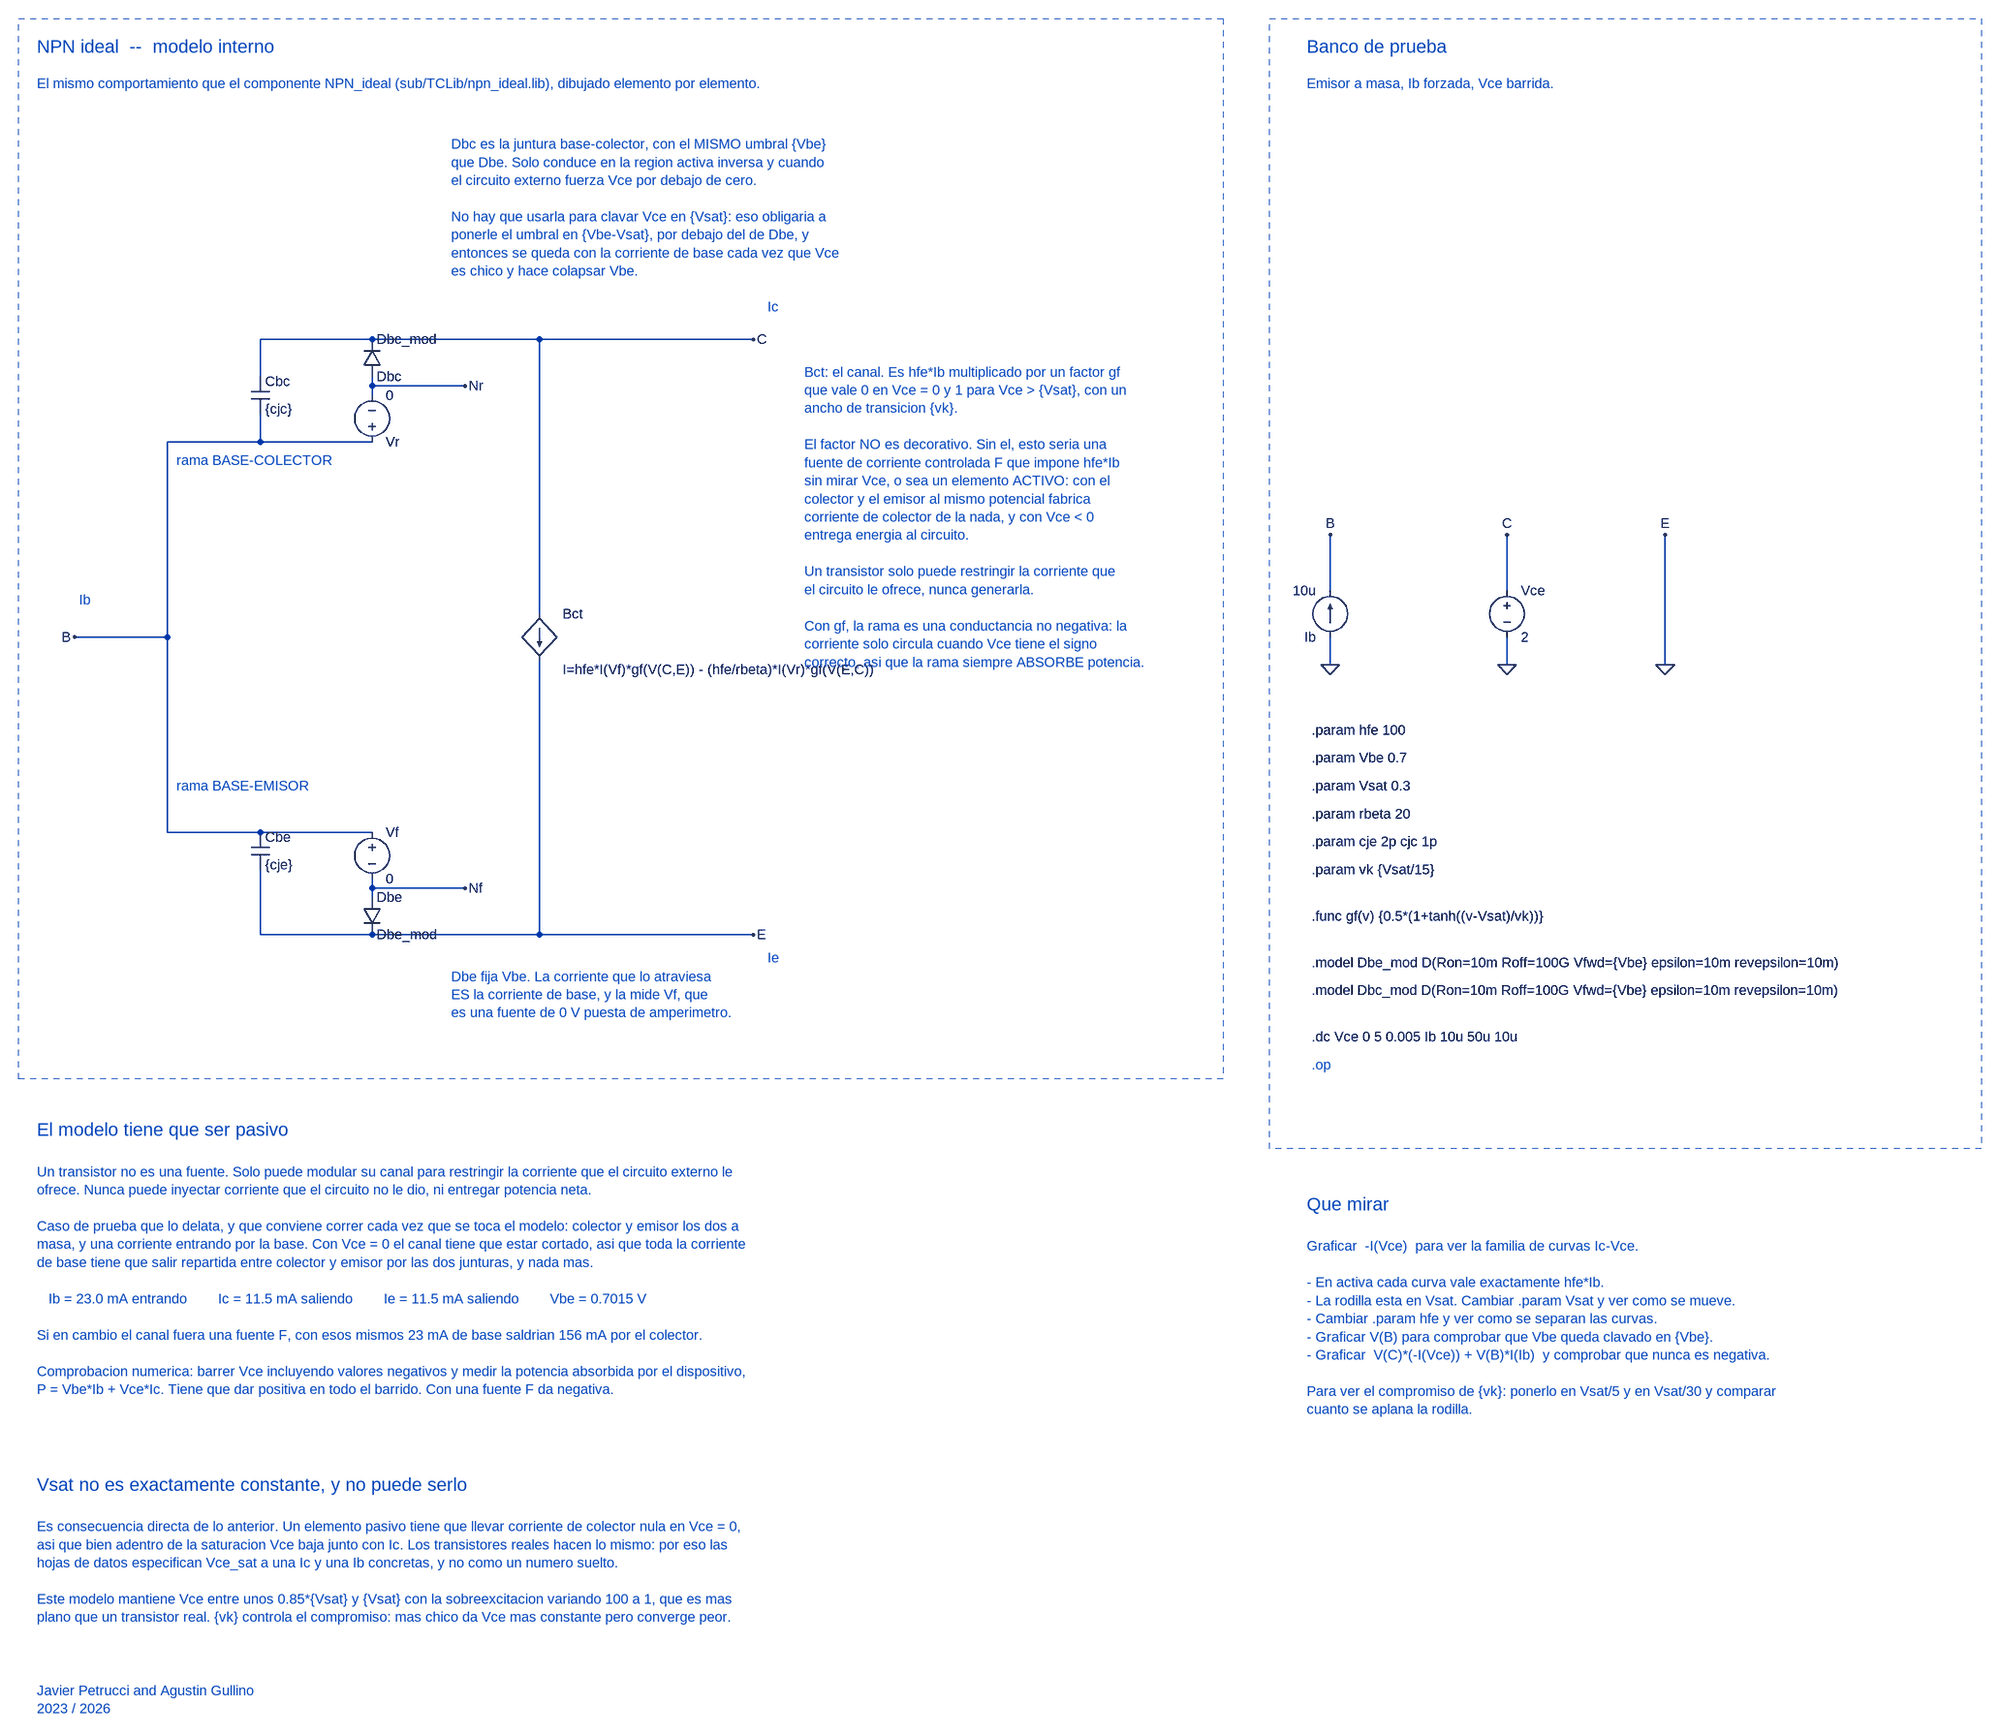
[diagram p0: schematic TC41 - BJT Ideal (modelo nuevo).asc]
TC41 - BJT Ideal (modelo nuevo).asc, the LTspice schematic file:
Version 4
SHEET 1 3200 2600
WIRE -160 -512 32 -512
WIRE 32 -512 320 -512
WIRE 320 -512 688 -512
WIRE -160 512 32 512
WIRE 32 512 320 512
WIRE 320 512 688 512
WIRE -320 -336 -160 -336
WIRE -160 -336 32 -336
WIRE -320 336 -160 336
WIRE -160 336 32 336
WIRE -320 -336 -320 0
WIRE -320 0 -320 336
WIRE -320 0 -480 0
WIRE 32 -416 32 -432
WIRE 32 -432 32 -448
WIRE 32 -432 192 -432
WIRE 32 416 32 432
WIRE 32 432 32 448
WIRE 32 432 192 432
WIRE 320 -512 320 -40
WIRE 320 40 320 512
WIRE -160 -512 -160 -448
WIRE -160 -384 -160 -336
WIRE -160 400 -160 512
WIRE 1680 -80 1680 -176
WIRE 1680 0 1680 48
WIRE 1984 -80 1984 -176
WIRE 1984 0 1984 48
WIRE 2256 -176 2256 48
FLAG -480 0 B
FLAG 688 -512 C
FLAG 688 512 E
FLAG 192 -432 Nr
FLAG 192 432 Nf
FLAG 1680 -176 B
FLAG 1680 48 0
FLAG 1984 -176 C
FLAG 1984 48 0
FLAG 2256 -176 E
FLAG 2256 48 0
SYMBOL voltage 32 -320 M180
WINDOW 123 0 0 Left 0
WINDOW 39 0 0 Left 0
SYMATTR InstName Vr
SYMATTR Value 0
SYMBOL diode 16 -448 M180
SYMATTR InstName Dbc
SYMATTR Value Dbc_mod
SYMBOL voltage 32 320 R0
WINDOW 123 0 0 Left 0
WINDOW 39 0 0 Left 0
SYMATTR InstName Vf
SYMATTR Value 0
SYMBOL diode 16 448 R0
SYMATTR InstName Dbe
SYMATTR Value Dbe_mod
SYMBOL bi 320 -40 R0
WINDOW 0 40 0 Left 2
WINDOW 3 40 96 Left 2
SYMATTR InstName Bct
SYMATTR Value I=hfe*I(Vf)*gf(V(C,E)) - (hfe/rbeta)*I(Vr)*gf(V(E,C))
SYMBOL cap -176 -448 R0
SYMATTR InstName Cbc
SYMATTR Value {cjc}
SYMBOL cap -176 336 R0
SYMATTR InstName Cbe
SYMATTR Value {cje}
SYMBOL current 1680 0 R180
WINDOW 123 0 0 Left 0
WINDOW 39 0 0 Left 0
SYMATTR InstName Ib
SYMATTR Value 10u
SYMBOL voltage 1984 -96 R0
WINDOW 123 0 0 Left 0
WINDOW 39 0 0 Left 0
SYMATTR InstName Vce
SYMATTR Value 2
TEXT -544 -1016 Left 3 ;NPN ideal  --  modelo interno
TEXT -544 -952 Left 2 ;El mismo comportamiento que el componente NPN_ideal (sub/TCLib/npn_ideal.lib), dibujado elemento por elemento.
TEXT 168 -848 Left 2 ;Dbc es la juntura base-colector, con el MISMO umbral {Vbe}\nque Dbe. Solo conduce en la region activa inversa y cuando\nel circuito externo fuerza Vce por debajo de cero.\n \nNo hay que usarla para clavar Vce en {Vsat}: eso obligaria a\nponerle el umbral en {Vbe-Vsat}, por debajo del de Dbe, y\nentonces se queda con la corriente de base cada vez que Vce\nes chico y hace colapsar Vbe.
TEXT 168 584 Left 2 ;Dbe fija Vbe. La corriente que lo atraviesa\nES la corriente de base, y la mide Vf, que\nes una fuente de 0 V puesta de amperimetro.
TEXT 776 -456 Left 2 ;Bct: el canal. Es hfe*Ib multiplicado por un factor gf\nque vale 0 en Vce = 0 y 1 para Vce > {Vsat}, con un\nancho de transicion {vk}.\n \nEl factor NO es decorativo. Sin el, esto seria una\nfuente de corriente controlada F que impone hfe*Ib\nsin mirar Vce, o sea un elemento ACTIVO: con el\ncolector y el emisor al mismo potencial fabrica\ncorriente de colector de la nada, y con Vce < 0\nentrega energia al circuito.\n \nUn transistor solo puede restringir la corriente que\nel circuito le ofrece, nunca generarla.\n \nCon gf, la rama es una conductancia no negativa: la\ncorriente solo circula cuando Vce tiene el signo\ncorrecto, asi que la rama siempre ABSORBE potencia.
TEXT -304 -304 Left 2 ;rama BASE-COLECTOR
TEXT -304 256 Left 2 ;rama BASE-EMISOR
TEXT 712 -568 Left 2 ;Ic
TEXT 712 552 Left 2 ;Ie
TEXT -472 -64 Left 2 ;Ib
TEXT -544 848 Left 3 ;El modelo tiene que ser pasivo
TEXT -544 920 Left 2 ;Un transistor no es una fuente. Solo puede modular su canal para restringir la corriente que el circuito externo le\nofrece. Nunca puede inyectar corriente que el circuito no le dio, ni entregar potencia neta.\n \nCaso de prueba que lo delata, y que conviene correr cada vez que se toca el modelo: colector y emisor los dos a\nmasa, y una corriente entrando por la base. Con Vce = 0 el canal tiene que estar cortado, asi que toda la corriente\nde base tiene que salir repartida entre colector y emisor por las dos junturas, y nada mas.\n \n   Ib = 23.0 mA entrando        Ic = 11.5 mA saliendo        Ie = 11.5 mA saliendo        Vbe = 0.7015 V\n \nSi en cambio el canal fuera una fuente F, con esos mismos 23 mA de base saldrian 156 mA por el colector.\n \nComprobacion numerica: barrer Vce incluyendo valores negativos y medir la potencia absorbida por el dispositivo,\nP = Vbe*Ib + Vce*Ic. Tiene que dar positiva en todo el barrido. Con una fuente F da negativa.
TEXT -544 1480 Left 3 ;Vsat no es exactamente constante, y no puede serlo
TEXT -544 1552 Left 2 ;Es consecuencia directa de lo anterior. Un elemento pasivo tiene que llevar corriente de colector nula en Vce = 0,\nasi que bien adentro de la saturacion Vce baja junto con Ic. Los transistores reales hacen lo mismo: por eso las\nhojas de datos especifican Vce_sat a una Ic y una Ib concretas, y no como un numero suelto.\n \nEste modelo mantiene Vce entre unos 0.85*{Vsat} y {Vsat} con la sobreexcitacion variando 100 a 1, que es mas\nplano que un transistor real. {vk} controla el compromiso: mas chico da Vce mas constante pero converge peor.
TEXT 1640 -1016 Left 3 ;Banco de prueba
TEXT 1640 -952 Left 2 ;Emisor a masa, Ib forzada, Vce barrida.
TEXT 1648 160 Left 2 !.param hfe 100
TEXT 1648 208 Left 2 !.param Vbe 0.7
TEXT 1648 256 Left 2 !.param Vsat 0.3
TEXT 1648 304 Left 2 !.param rbeta 20
TEXT 1648 352 Left 2 !.param cje 2p cjc 1p
TEXT 1648 400 Left 2 !.param vk {Vsat/15}
TEXT 1648 480 Left 2 !.func gf(v) {0.5*(1+tanh((v-Vsat)/vk))}
TEXT 1648 560 Left 2 !.model Dbe_mod D(Ron=10m Roff=100G Vfwd={Vbe} epsilon=10m revepsilon=10m)
TEXT 1648 608 Left 2 !.model Dbc_mod D(Ron=10m Roff=100G Vfwd={Vbe} epsilon=10m revepsilon=10m)
TEXT 1648 688 Left 2 !.dc Vce 0 5 0.005 Ib 10u 50u 10u
TEXT 1648 736 Left 2 ;.op
TEXT 1640 976 Left 3 ;Que mirar
TEXT 1640 1048 Left 2 ;Graficar  -I(Vce)  para ver la familia de curvas Ic-Vce.\n \n- En activa cada curva vale exactamente hfe*Ib.\n- La rodilla esta en Vsat. Cambiar .param Vsat y ver como se mueve.\n- Cambiar .param hfe y ver como se separan las curvas.\n- Graficar V(B) para comprobar que Vbe queda clavado en {Vbe}.\n- Graficar  V(C)*(-I(Vce)) + V(B)*I(Ib)  y comprobar que nunca es negativa.\n \nPara ver el compromiso de {vk}: ponerlo en Vsat/5 y en Vsat/30 y comparar\ncuanto se aplana la rodilla.
TEXT -544 2016 Left 2 ;Javier Petrucci and Agustin Gullino\n2023 / 2026
RECTANGLE Normal 1496 760 -576 -1064 2
RECTANGLE Normal 2800 880 1576 -1064 2

The netlist it stands for:
* TC41 - BJT Ideal (modelo nuevo).asc
Vr B Nr 0
Dbc Nr C Dbc_mod
Vf B Nf 0
Dbe Nf 0 Dbe_mod
Bct C 0 I=hfe*I(Vf)*gf(V(C,E)) - (hfe/rbeta)*I(Vr)*gf(V(E,C))
Cbc C B {cjc}
Cbe B 0 {cje}
Ib 0 B 10u
Vce C 0 2
.model D D
.lib standard.dio
* NPN ideal  --  modelo interno
* El mismo comportamiento que el componente NPN_ideal (sub/TCLib/npn_ideal.lib), dibujado elemento por elemento.
* Dbc es la juntura base-colector, con el MISMO umbral {Vbe}
* que Dbe. Solo conduce en la region activa inversa y cuando
* el circuito externo fuerza Vce por debajo de cero.
* No hay que usarla para clavar Vce en {Vsat}: eso obligaria a
* ponerle el umbral en {Vbe-Vsat}, por debajo del de Dbe, y
* entonces se queda con la corriente de base cada vez que Vce
* es chico y hace colapsar Vbe.
* Dbe fija Vbe. La corriente que lo atraviesa
* ES la corriente de base, y la mide Vf, que
* es una fuente de 0 V puesta de amperimetro.
* Bct: el canal. Es hfe*Ib multiplicado por un factor gf
* que vale 0 en Vce = 0 y 1 para Vce > {Vsat}, con un
* ancho de transicion {vk}.
* El factor NO es decorativo. Sin el, esto seria una
* fuente de corriente controlada F que impone hfe*Ib
* sin mirar Vce, o sea un elemento ACTIVO: con el
* colector y el emisor al mismo potencial fabrica
* corriente de colector de la nada, y con Vce < 0
* entrega energia al circuito.
* Un transistor solo puede restringir la corriente que
* el circuito le ofrece, nunca generarla.
* Con gf, la rama es una conductancia no negativa: la
* corriente solo circula cuando Vce tiene el signo
* correcto, asi que la rama siempre ABSORBE potencia.
* rama BASE-COLECTOR
* rama BASE-EMISOR
* Ic
* Ie
* Ib
* El modelo tiene que ser pasivo
* Un transistor no es una fuente. Solo puede modular su canal para restringir la corriente que el circuito externo le
* ofrece. Nunca puede inyectar corriente que el circuito no le dio, ni entregar potencia neta.
* Caso de prueba que lo delata, y que conviene correr cada vez que se toca el modelo: colector y emisor los dos a
* masa, y una corriente entrando por la base. Con Vce = 0 el canal tiene que estar cortado, asi que toda la corriente
* de base tiene que salir repartida entre colector y emisor por las dos junturas, y nada mas.
*    Ib = 23.0 mA entrando        Ic = 11.5 mA saliendo        Ie = 11.5 mA saliendo        Vbe = 0.7015 V
* Si en cambio el canal fuera una fuente F, con esos mismos 23 mA de base saldrian 156 mA por el colector.
* Comprobacion numerica: barrer Vce incluyendo valores negativos y medir la potencia absorbida por el dispositivo,
* P = Vbe*Ib + Vce*Ic. Tiene que dar positiva en todo el barrido. Con una fuente F da negativa.
* Vsat no es exactamente constante, y no puede serlo
* Es consecuencia directa de lo anterior. Un elemento pasivo tiene que llevar corriente de colector nula en Vce = 0,
* asi que bien adentro de la saturacion Vce baja junto con Ic. Los transistores reales hacen lo mismo: por eso las
* hojas de datos especifican Vce_sat a una Ic y una Ib concretas, y no como un numero suelto.
* Este modelo mantiene Vce entre unos 0.85*{Vsat} y {Vsat} con la sobreexcitacion variando 100 a 1, que es mas
* plano que un transistor real. {vk} controla el compromiso: mas chico da Vce mas constante pero converge peor.
* Banco de prueba
* Emisor a masa, Ib forzada, Vce barrida.
.param hfe 100
.param Vbe 0.7
.param Vsat 0.3
.param rbeta 20
.param cje 2p cjc 1p
.param vk {Vsat/15}
.func gf(v) {0.5*(1+tanh((v-Vsat)/vk))}
.model Dbe_mod D(Ron=10m Roff=100G Vfwd={Vbe} epsilon=10m revepsilon=10m)
.model Dbc_mod D(Ron=10m Roff=100G Vfwd={Vbe} epsilon=10m revepsilon=10m)
.dc Vce 0 5 0.005 Ib 10u 50u 10u
* .op
* Que mirar
* Graficar  -I(Vce)  para ver la familia de curvas Ic-Vce.
* - En activa cada curva vale exactamente hfe*Ib.
* - La rodilla esta en Vsat. Cambiar .param Vsat y ver como se mueve.
* - Cambiar .param hfe y ver como se separan las curvas.
* - Graficar V(B) para comprobar que Vbe queda clavado en {Vbe}.
* - Graficar  V(C)*(-I(Vce)) + V(B)*I(Ib)  y comprobar que nunca es negativa.
* Para ver el compromiso de {vk}: ponerlo en Vsat/5 y en Vsat/30 y comparar
* cuanto se aplana la rodilla.
* Javier Petrucci and Agustin Gullino
* 2023 / 2026
.backanno
.end